# Altium schematic sheet 08 - JTAG.SchDoc
size A3; SheetNumber: 6; SheetTotal: 7
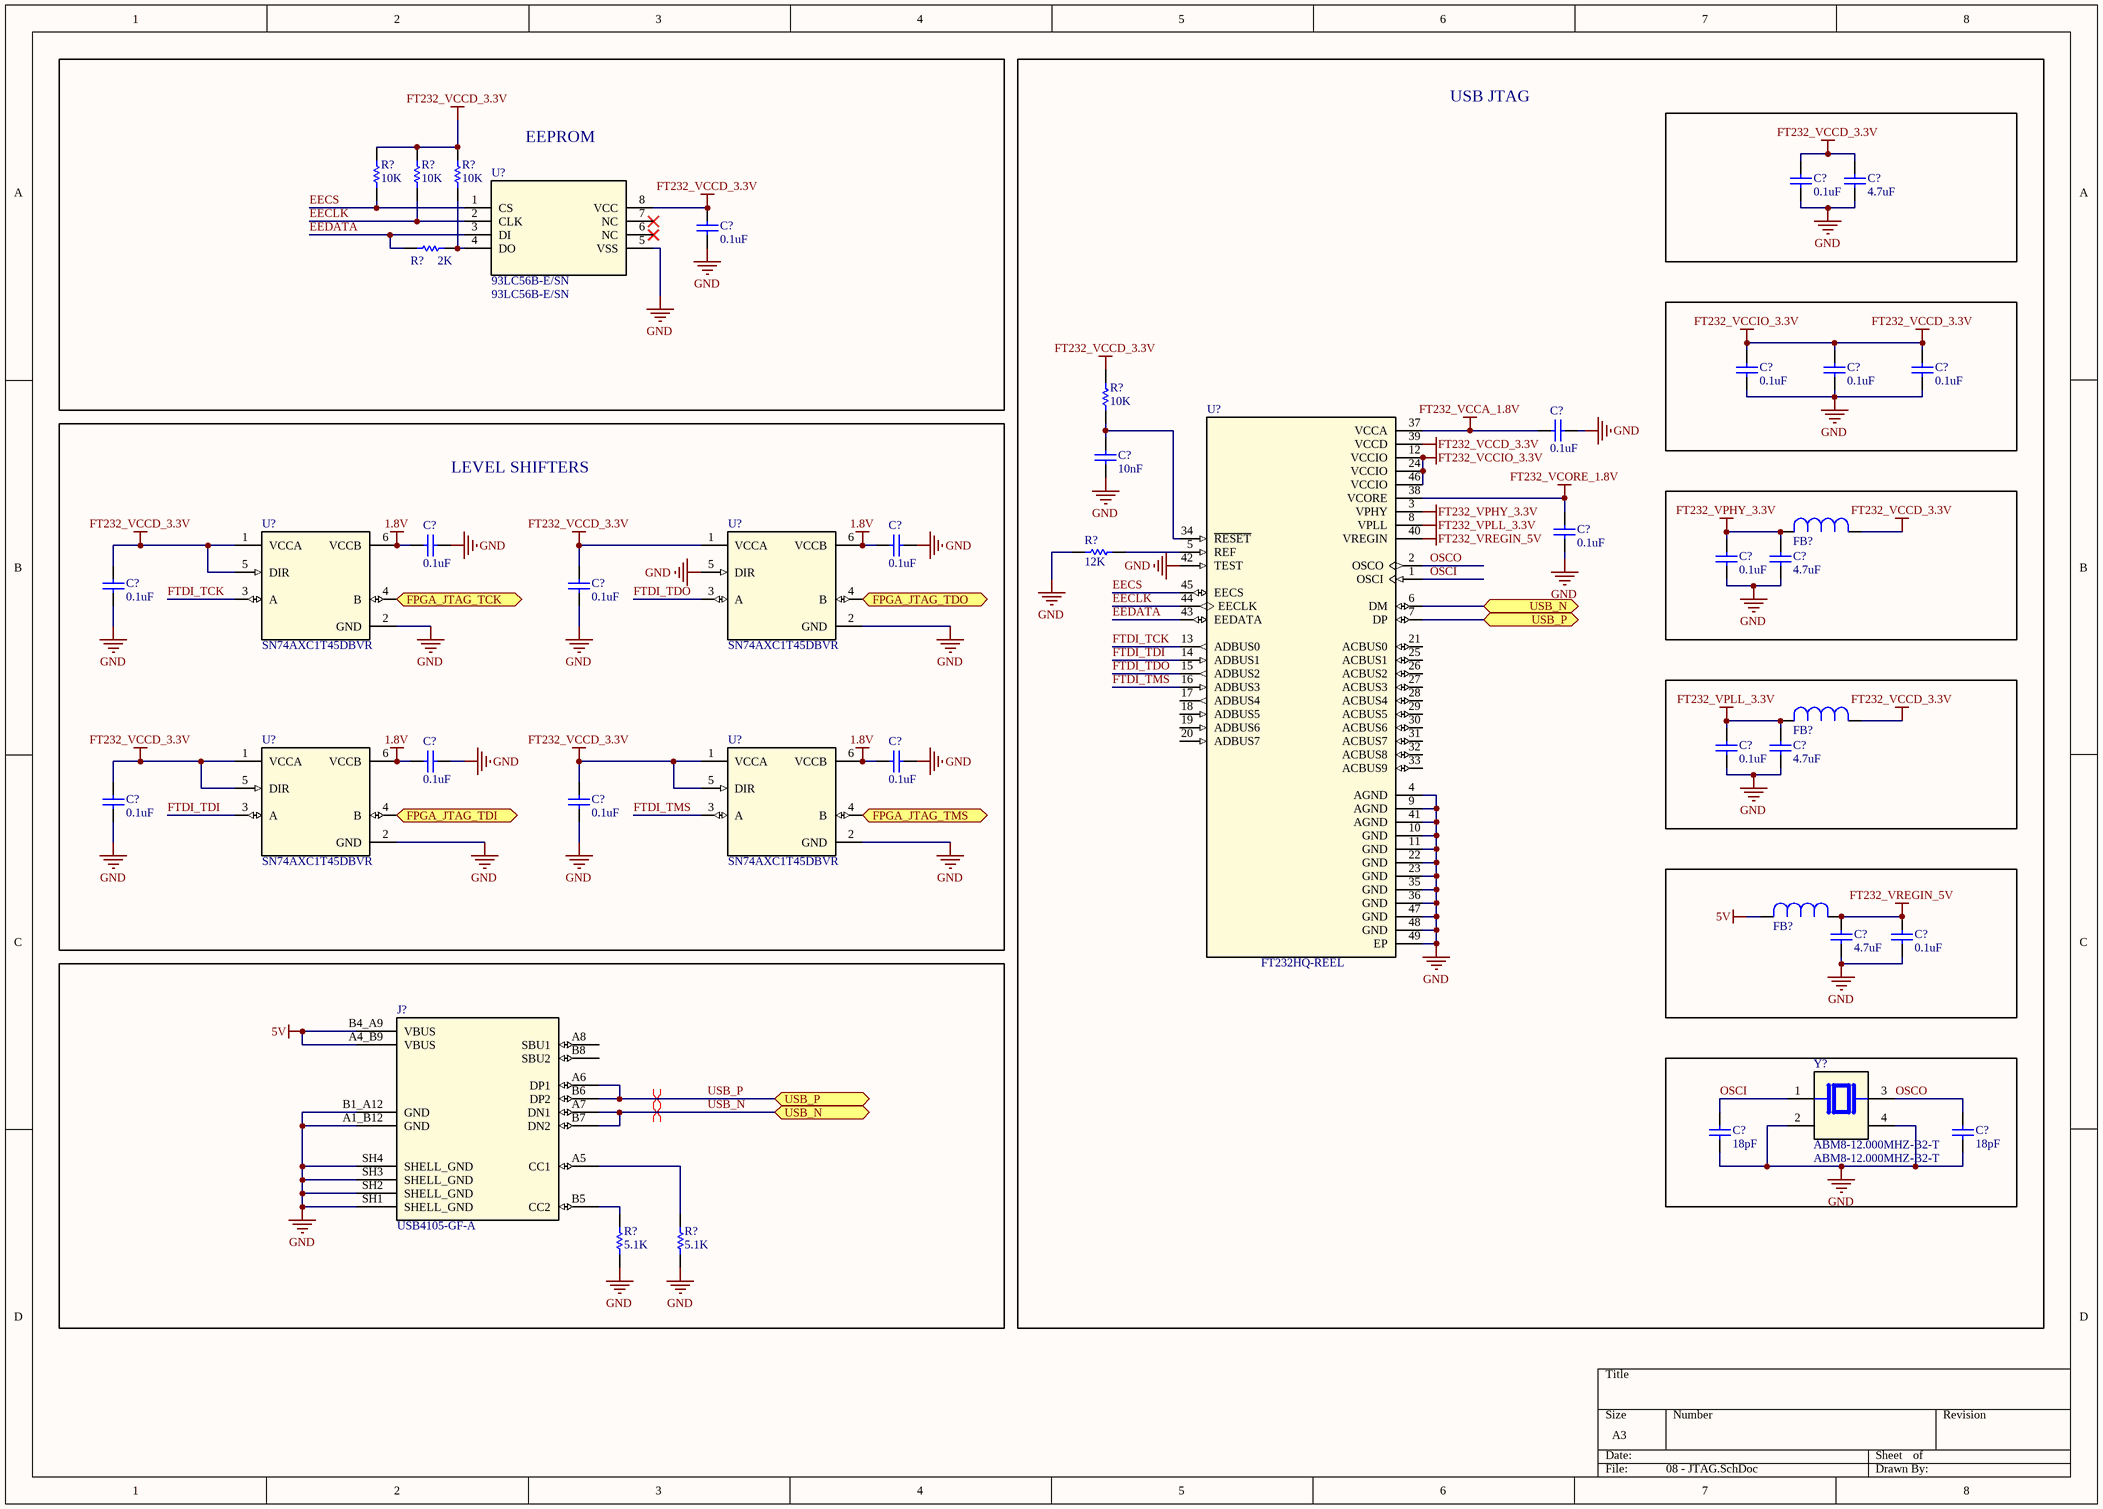
[diagram p0: 08 - JTAG.SchDoc]

## Parts
(Parts that share a designator on the sheet are numbered #1, #2 ... from top to bottom, then left to right.)
C?#1  value 0.1uF  [0402-C-R]  (hidden comment: GRM155R61E104KA87D)
C?#2  value 4.7uF  [0402-C-R]  (hidden comment: GRM155D81C475ME15J)
C?#3  value 0.1uF  [0402-C-R]  (hidden comment: GRM155R61E104KA87D)
C?#4  value 0.1uF  [0402-C-R]  (hidden comment: GRM155R61E104KA87D)
C?#5  value 0.1uF  [0402-C-R]  (hidden comment: GRM155R61E104KA87D)
C?#6  value 0.1uF  [0402-C-R]  (hidden comment: GRM155R61E104KA87D)
C?#7  value 0.1uF  [0402-C-R]  (hidden comment: GRM155R61E104KA87D)
C?#8  value 10nF  [0402-C-R]  (hidden comment: KGM05AR71E103KH)
C?#9  value 0.1uF  [0402-C-R]  (hidden comment: GRM155R61E104KA87D)
C?#10  value 0.1uF  [0402-C-R]  (hidden comment: GRM155R61E104KA87D)
C?#11  value 0.1uF  [0402-C-R]  (hidden comment: GRM155R61E104KA87D)
C?#12  value 0.1uF  [0402-C-R]  (hidden comment: GRM155R61E104KA87D)
C?#13  value 4.7uF  [0402-C-R]  (hidden comment: GRM155D81C475ME15J)
C?#14  value 0.1uF  [0402-C-R]  (hidden comment: GRM155R61E104KA87D)
C?#15  value 0.1uF  [0402-C-R]  (hidden comment: GRM155R61E104KA87D)
C?#16  value 0.1uF  [0402-C-R]  (hidden comment: GRM155R61E104KA87D)
C?#17  value 0.1uF  [0402-C-R]  (hidden comment: GRM155R61E104KA87D)
C?#18  value 0.1uF  [0402-C-R]  (hidden comment: GRM155R61E104KA87D)
C?#19  value 4.7uF  [0402-C-R]  (hidden comment: GRM155D81C475ME15J)
C?#20  value 0.1uF  [0402-C-R]  (hidden comment: GRM155R61E104KA87D)
C?#21  value 0.1uF  [0402-C-R]  (hidden comment: GRM155R61E104KA87D)
C?#22  value 4.7uF  [0402-C-R]  (hidden comment: GRM155D81C475ME15J)
C?#23  value 0.1uF  [0402-C-R]  (hidden comment: GRM155R61E104KA87D)
C?#24  value 18pF  [0402-C-R]  (hidden comment: GRM1555C1H180JA01D)
C?#25  value 18pF  [0402-C-R]  (hidden comment: GRM1555C1H180JA01D)
FB?#1  BLM15HD182SN1D  [0402-F-R]  (value not drawn)
FB?#2  BLM15HD182SN1D  [0402-F-R]  (value not drawn)
FB?#3  BLM15HD182SN1D  [0402-F-R]  (value not drawn)
J?  PN: USB4105-GF-A  [GCT_USB4105-GF-A]  (hidden comment: CONN RCP USB2.0 TYP C 24P SMD RA)
R?#1  value 10K  [0402-R-R]  (hidden comment: RC0402FR-0710KL)
R?#2  value 10K  [0402-R-R]  (hidden comment: RC0402FR-0710KL)
R?#3  value 10K  [0402-R-R]  (hidden comment: RC0402FR-0710KL)
R?#4  value 2K  [0402-R-R]  (hidden comment: RMCF0402FT2K00)
R?#5  value 10K  [0402-R-R]  (hidden comment: RC0402FR-0710KL)
R?#6  value 12K  [0402-R-R]  (hidden comment: RMCF0402FT12K0)
R?#7  value 5.1K  [0402-R-R]  (hidden comment: RMCF0402FT5K10)
R?#8  value 5.1K  [0402-R-R]  (hidden comment: RMCF0402FT5K10)
U?#1  93LC56B-E/SN  [93LC56B-E/SN]
U?#2  SN74AXC1T45DBVR  [SN74AXC1T45DBVR]
U?#3  SN74AXC1T45DBVR  [SN74AXC1T45DBVR]
U?#4  PN: FT232HQ-REEL  [FT232HQ]  (hidden comment: IC HS USB TO UART/FIFO 48QFN)
U?#5  SN74AXC1T45DBVR  [SN74AXC1T45DBVR]
U?#6  SN74AXC1T45DBVR  [SN74AXC1T45DBVR]
Y?  ABM8-12.000MHZ-B2-T  [XTAL_ABM8-12.000MHZ-B2-T]

## Blocks framed on the sheet
EEPROM: C?#3 R?#1-R?#4 U?#1
USB JTAG: C?#1 C?#2 C?#4-C?#9 C?#12 C?#13 C?#18 C?#19 C?#22-C?#25 FB?#1-FB?#3 R?#5 R?#6 U?#4 Y?
LEVEL SHIFTERS: C?#10 C?#11 C?#14-C?#17 C?#20 C?#21 U?#2 U?#3 U?#5 U?#6

## Ports
FPGA_JTAG_TCK (bidir), FPGA_JTAG_TDI (bidir), FPGA_JTAG_TDO (bidir), FPGA_JTAG_TMS (bidir), USB_N (bidir), USB_P (bidir)

## Nets
1.8V: C?#10.2 C?#11.2 C?#16.2 C?#17.2 U?#2.6(VCCB) U?#3.6(VCCB) U?#5.6(VCCB) U?#6.6(VCCB)
5V: FB?#3.2 J?.A4_B9(VBUS) J?.B4_A9(VBUS)
FT232_VCCA_1.8V: C?#7.2 U?#4.37(VCCA)
FT232_VCCD_3.3V: C?#1.2 C?#2.2 C?#3.2 C?#4.2 C?#5.2 C?#6.2 C?#14.2 C?#15.2 C?#20.2 C?#21.2 FB?#1.1 FB?#2.1 R?#1.2 R?#2.2 R?#3.2 R?#5.2 U?#1.8(VCC) U?#2.1(VCCA) U?#2.5(DIR) U?#3.1(VCCA) U?#4.12(VCCIO) U?#4.24(VCCIO) U?#4.39(VCCD) U?#4.46(VCCIO) U?#5.1(VCCA) U?#5.5(DIR) U?#6.1(VCCA) U?#6.5(DIR)  [also labelled FT232_VCCIO_3.3V]
FT232_VCORE_1.8V: C?#9.1 U?#4.38(VCORE)
FT232_VPHY_3.3V: C?#12.2 C?#13.2 FB?#1.2 U?#4.3(VPHY)
FT232_VPLL_3.3V: C?#18.2 C?#19.2 FB?#2.2 U?#4.8(VPLL)
FT232_VREGIN_5V: C?#22.2 C?#23.2 FB?#3.1 U?#4.40(VREGIN)
GND: C?#1.1 C?#2.1 C?#3.1 C?#4.1 C?#5.1 C?#6.1 C?#7.1 C?#8.1 C?#9.2 C?#10.1 C?#11.1 C?#12.1 C?#13.1 C?#14.1 C?#15.1 C?#16.1 C?#17.1 C?#18.1 C?#19.1 C?#20.1 C?#21.1 C?#22.1 C?#23.1 C?#24.1 C?#25.1 J?.A1_B12(GND) J?.B1_A12(GND) J?.SH1(SHELL_GND) J?.SH2(SHELL_GND) J?.SH3(SHELL_GND) J?.SH4(SHELL_GND) R?#6.1 R?#7.1 R?#8.1 U?#1.5(VSS) U?#2.2(GND) U?#3.2(GND) U?#3.5(DIR) U?#4.4(AGND) U?#4.9(AGND) U?#4.10(GND) U?#4.11(GND) U?#4.22(GND) U?#4.23(GND) U?#4.35(GND) U?#4.36(GND) U?#4.41(AGND) U?#4.42(TEST) U?#4.47(GND) U?#4.48(GND) U?#4.49(EP) U?#5.2(GND) U?#6.2(GND) Y?.2(GND) Y?.4(GND)
EECLK: R?#2.1 U?#1.2(CLK) U?#4.44(EECLK)
EECS: R?#1.1 U?#1.1(CS) U?#4.45(EECS)
EEDATA: R?#4.1 U?#1.3(DI) U?#4.43(EEDATA)
FPGA_JTAG_TCK: U?#2.4(B) ; port FPGA_JTAG_TCK
FPGA_JTAG_TDI: U?#5.4(B) ; port FPGA_JTAG_TDI
FPGA_JTAG_TDO: U?#3.4(B) ; port FPGA_JTAG_TDO
FPGA_JTAG_TMS: U?#6.4(B) ; port FPGA_JTAG_TMS
FTDI_TCK: U?#2.3(A) U?#4.13(ADBUS0)
FTDI_TDI: U?#4.14(ADBUS1) U?#5.3(A)
FTDI_TDO: U?#3.3(A) U?#4.15(ADBUS2)
FTDI_TMS: U?#4.16(ADBUS3) U?#6.3(A)
OSCI: C?#24.2 U?#4.1(OSCI) Y?.1
OSCO: C?#25.2 U?#4.2(OSCO) Y?.3
USB_N: J?.A7(DN1) J?.B7(DN2) U?#4.6(DM) ; port USB_N
USB_P: J?.A6(DP1) J?.B6(DP2) U?#4.7(DP) ; port USB_P
NetC?#8_2: C?#8.2 R?#5.1 U?#4.34(~{RESET})
NetJ?_A5: J?.A5(CC1) R?#8.2
NetJ?_B5: J?.B5(CC2) R?#7.2
NetR?#3_1: R?#3.1 R?#4.2 U?#1.4(DO)
NetR?#6_2: R?#6.2 U?#4.5(REF)

Not connected (* = marked no-connect by the designer): J? A8(SBU1) B8(SBU2); U?#1 6(NC)* 7(NC)*; U?#4 17(ADBUS4) 18(ADBUS5) 19(ADBUS6) 20(ADBUS7) 21(ACBUS0) 25(ACBUS1) 26(ACBUS2) 27(ACBUS3) 28(ACBUS4) 29(ACBUS5) 30(ACBUS6) 31(ACBUS7) 32(ACBUS8) 33(ACBUS9)

## Layout directives
differential pair: USB_N, USB_P

## Library data of the parts
C?#1 C?#3-C?#7 C?#9-C?#12 C?#14-C?#18 C?#20 C?#21 C?#23 = CAP CER 0.1UF 25V X5R 0402: 0.1 µF ±10% 25V Ceramic Capacitor X5R 0402 (1005 Metric); SIZE: 0402; PN: GRM155R61E104KA87D; VOLTAGE: 25V; TOLERANCE: 10%
C?#2 = CAP CER 4.7UF 10V X5R 0402: CAP SMD 0402 MLCC GERAL 4.7uF 25V ±20% 0402 X5s PN: GRM155D81C475ME15J MURATA; SIZE: 0402; VOLTAGE: 25V; TOLERANCE: 20%; PN: GRM155D81C475ME15J
C?#8 = CAP CER 10nF 25V X7R 0402: 10000 pF ±10% 25V Ceramic Capacitor X7R 0402 (1005 Metric); SIZE: 0402; VOLTAGE: 25V; TOLERANCE: 10%; PN: KGM05AR71E103KH
C?#13 C?#19 C?#22 = CAP CER 4.7UF 25V X5R 0402: CAP SMD 0402 MLCC GERAL 4.7uF 25V ±20% 0402 X5s PN: GRM155D81C475ME15J MURATA; SIZE: 0402; VOLTAGE: 25V; TOLERANCE: 20%; PN: GRM155D81C475ME15J
C?#24 C?#25 = CAP CER 18PF 50V C0G/NP0 0402: 18 pF ±5% 50V Capacitor de cerâmica C0G, NP0 0402 (métrico 1005)PN:GRM1555C1H180JA01D MURATA; SIZE: 0402; VOLTAGE: 50V; TOLERANCE: 5%; PN: GRM1555C1H180JA01D
FB?#1-FB?#3 = FERRITE BEAD 1.8K OHM 0402 1LN: FERRITE BEAD 1.8K OHM 0402 1LN PN: BLM15HD182SN1D; Mfr_Name: Murata; PN: BLM15HD182SN1D
J? = CONN RCP USB2.0 TYP C 24P SMD RA: CONN RCP USB2.0 TYP C 24P SMD RA PN: USB4105-GF-A; MF: {'manufacturer': u'GCT'}; Package: None; Price: None; Availability: Unavailable; Value: *
R?#1-R?#3 R?#5 = RES 10K OHM 1% 1/16W 0402: 10 kOhms ±1% 0,063W, 1/16W Resistor de chip 0402 (métrico 1005) Resistente à umidade Filme grosso; PACK: 0402; POWER: 0.063W; TOLERANCE: 1%; PN: RC0402FR-0710KL
R?#4 = RES SMD 0402 2K 0.063W ±1%: RES SMD GERAL FILM 2K 0.063W ±1% 0402 7" TAPE PN: RMCF0402FT2K00 STACKPOLE; PACK: 0402; POWER: 0.063W; TOLERANCE: 1%; PN: RMCF0402FT2K00
R?#6 = RES SMD 0402 12K 0.063W ±1%: RES SMD GERAL FILM 12K 0.063W ±1% 0402 7" TAPE PN: RMCF0402FT12K0; PACK: 0402; POWER: 0.063W; TOLERANCE: 1%; PN: RMCF0402FT12K0
R?#7 R?#8 = RES SMD 0402 5.1K OHM 1% 1/16W: RES SMD 0402 5.1K OHM 1% 1/16W 0402 PN: RMCF0402FT5K10; PACK: 0402; TOLERANCE: 0.1%; POWER: 0.063W; PN: RMCF0402FT5K10
U?#1 = IC EEPROM 2KBIT MICROWIRE 8SOIC: EEPROM CI de memória 2Kbit Microwire 2 MHz 8-SOIC. PN: 93LC56B-E/SN; Mfr_Name: Microchip; RefDes: RefDes; Type: Type; PN: 93LC56B-E/SN
U?#2 U?#3 U?#5 U?#6 = IC TRANSLATOR BIDIR SOT23-6: Nível de tensão Tradutor Bidirecional 1 Circuito 1 Canal 500Mbps SOT-23-6. PN: SN74AXC1T45DBVR; MF: Texas Instruments; SnapEDA_Link: https://www.snapeda.com/parts/SN74AXC1T45DBVR/Texas+Instruments/view-part/?ref=snap; Availability: In Stock; MP: SN74AXC1T45DBVR; Price: None; Purchase-URL: https://pricing.snapeda.com/search/part/SN74AXC1T45DBVR/?ref=eda; Check_prices: https://www.snapeda.com/parts/SN74AXC1T45DBVR/Texas+Instruments/view-part/?ref=eda; Package: SOT-23-6 Texas Instruments; Parameter 1: *; Value: *; PN: SN74AXC1T45DBVR
U?#4 = IC HS USB TO UART/FIFO 48QFN: USB Bridge, USB to UART,FIFO USB 2.0 UART, FIFO Interface 48-QFN (8x8) PN: FT232HQ-REEL; MF: FTDI, Future; MP: FT232HQ-REEL; SnapEDA_Link: https://www.snapeda.com/parts/FT232HQ-REEL/FTDI,%20Future%20Technology%20Devices%20International%20Ltd/view-part/52946/?ref=snap; Check_prices: https://www.snapeda.com/parts/FT232HQ-REEL/FTDI,%20Future%20Technology%20Devices%20International%20Ltd/view-part/52946/?ref=eda; Price: None; Availability: Good; Purchase-URL: https://pricing.snapeda.com/search/part/FT232HQ-REEL/?ref=eda; Package: QFN-48 FTDI; Value: *
Y? = CRYSTAL 12.0000MHZ 18PF SMD: 12 MHz ±20ppm Cristal 18pF 120 Ohms 4-SMD, sem condutores PN: ABM8-12.000MHZ-B2-T; MF: Abracon; SnapEDA_Link: https://www.snapeda.com/parts/ABM8-12.000MHZ-B2-T/Abracon+LLC/view-part/?ref=snap; Price: None; Value: *; MP: ABM8-12.000MHZ-B2-T; Check_prices: https://www.snapeda.com/parts/ABM8-12.000MHZ-B2-T/Abracon+LLC/view-part/?ref=eda; Availability: In Stock; Package: NON-STANDARD-4 Abracon; Purchase-URL: https://pricing.snapeda.com/search/part/ABM8-12.000MHZ-B2-T/?ref=eda; PN: ABM8-12.000MHZ-B2-T